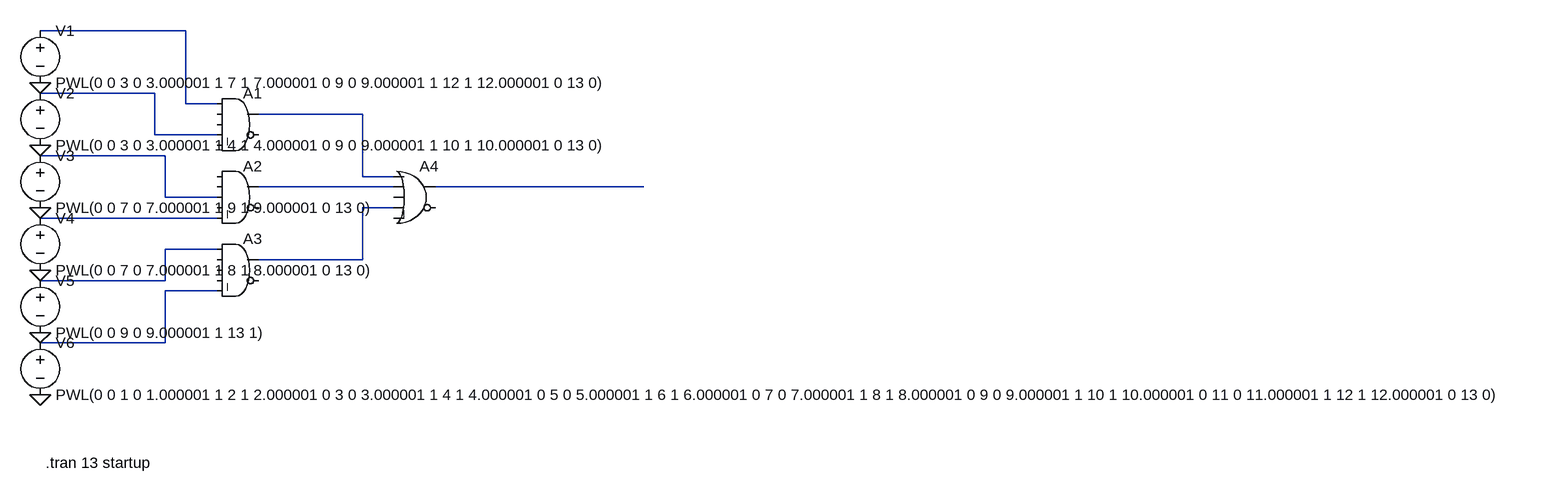
[diagram p0: schematic ques_48.asc]
ques_48.asc, the LTspice schematic file:
Version 4.1
SHEET 1 2300 680
WIRE 64 -64 -160 -64
WIRE 16 32 -160 32
WIRE 64 48 64 -64
WIRE 112 48 64 48
WIRE 336 64 176 64
WIRE 16 96 16 32
WIRE 112 96 16 96
WIRE 32 128 -160 128
WIRE 336 160 336 64
WIRE 384 160 336 160
WIRE 384 176 176 176
WIRE 768 176 448 176
WIRE 32 192 32 128
WIRE 112 192 32 192
WIRE 384 208 336 208
WIRE 112 224 -160 224
WIRE 112 272 32 272
WIRE 336 288 336 208
WIRE 336 288 176 288
WIRE 32 320 32 272
WIRE 32 320 -160 320
WIRE 112 336 32 336
WIRE 32 416 32 336
WIRE 32 416 -160 416
FLAG -160 16 0
FLAG -160 112 0
FLAG -160 208 0
FLAG -160 304 0
FLAG -160 400 0
FLAG -160 496 0
SYMBOL Digital\\and 144 16 R0
SYMATTR InstName A1
SYMBOL Digital\\and 144 128 R0
SYMATTR InstName A2
SYMBOL Digital\\and 144 240 R0
SYMATTR InstName A3
SYMBOL Digital\\or 416 128 R0
SYMATTR InstName A4
SYMBOL voltage -160 -80 R0
WINDOW 123 0 0 Left 0
WINDOW 39 0 0 Left 0
SYMATTR InstName V1
SYMATTR Value PWL(0 0 3 0 3.000001 1 7 1 7.000001 0 9 0 9.000001 1 12 1 12.000001 0 13 0)
SYMBOL voltage -160 16 R0
WINDOW 123 0 0 Left 0
WINDOW 39 0 0 Left 0
SYMATTR InstName V2
SYMATTR Value PWL(0 0 3 0 3.000001 1 4 1 4.000001 0 9 0 9.000001 1 10 1 10.000001 0 13 0)
SYMBOL voltage -160 112 R0
WINDOW 123 0 0 Left 0
WINDOW 39 0 0 Left 0
SYMATTR InstName V3
SYMATTR Value PWL(0 0 7 0 7.000001 1 9 1 9.000001 0 13 0)
SYMBOL voltage -160 208 R0
WINDOW 123 0 0 Left 0
WINDOW 39 0 0 Left 0
SYMATTR InstName V4
SYMATTR Value PWL(0 0 7 0 7.000001 1 8 1 8.000001 0 13 0)
SYMBOL voltage -160 304 R0
WINDOW 123 0 0 Left 0
WINDOW 39 0 0 Left 0
SYMATTR InstName V5
SYMATTR Value PWL(0 0 9 0 9.000001 1 13 1)
SYMBOL voltage -160 400 R0
WINDOW 123 0 0 Left 0
WINDOW 39 0 0 Left 0
SYMATTR InstName V6
SYMATTR Value PWL(0 0 1 0 1.000001 1 2 1 2.000001 0 3 0 3.000001 1 4 1 4.000001 0 5 0 5.000001 1 6 1 6.000001 0 7 0 7.000001 1 8 1 8.000001 0 9 0 9.000001 1 10 1 10.000001 0 11 0 11.000001 1 12 1 12.000001 0 13 0)
TEXT -152 600 Left 2 !.tran 13 startup

The netlist it stands for:
* ques_48.asc
A1 N001 0 0 N002 0 0 N003 0 AND
A2 0 0 N004 0 N008 0 N005 0 AND
A3 N009 0 0 0 N010 0 N007 0 AND
A4 N003 N005 0 N007 0 0 N006 0 OR
V1 N001 0 PWL(0 0 3 0 3.000001 1 7 1 7.000001 0 9 0 9.000001 1 12 1 12.000001 0 13 0)
V2 N002 0 PWL(0 0 3 0 3.000001 1 4 1 4.000001 0 9 0 9.000001 1 10 1 10.000001 0 13 0)
V3 N004 0 PWL(0 0 7 0 7.000001 1 9 1 9.000001 0 13 0)
V4 N008 0 PWL(0 0 7 0 7.000001 1 8 1 8.000001 0 13 0)
V5 N009 0 PWL(0 0 9 0 9.000001 1 13 1)
V6 N010 0 PWL(0 0 1 0 1.000001 1 2 1 2.000001 0 3 0 3.000001 1 4 1 4.000001 0 5 0 5.000001 1 6 1 6.000001 0 7 0 7.000001 1 8 1 8.000001 0 9 0 9.000001 1 10 1 10.000001 0 11 0 11.000001 1 12 1 12.000001 0 13 0)
.tran 13 startup
.backanno
.end